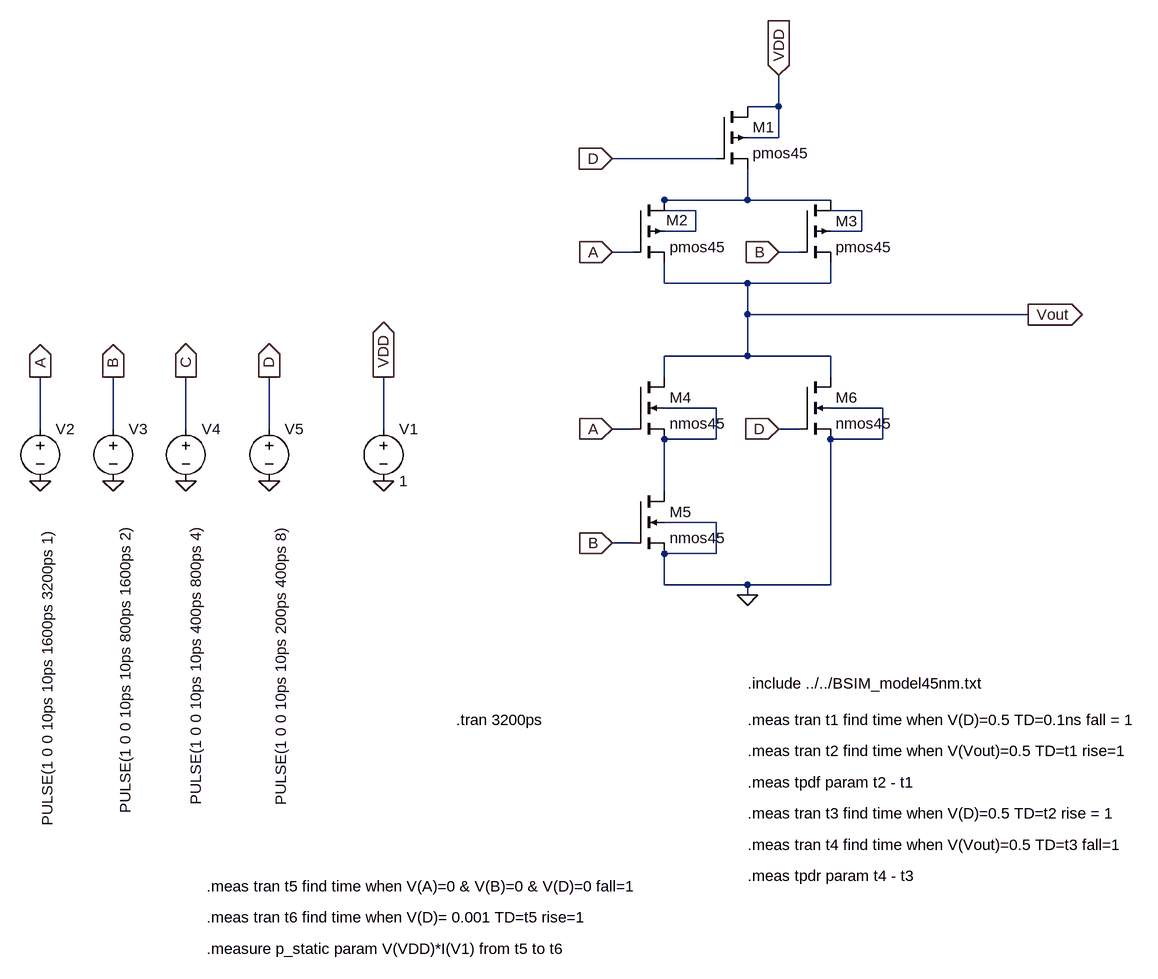
[diagram p0: schematic Eksamen_Kredsloeb.asc]
Eksamen_Kredsloeb.asc, the LTspice schematic file:
Version 4
SHEET 1 880 1536
WIRE -64 224 -64 176
WIRE -64 224 -112 224
WIRE -64 272 -64 224
WIRE -64 272 -112 272
WIRE -160 304 -320 304
WIRE -112 368 -112 320
WIRE -112 368 -240 368
WIRE 16 368 -112 368
WIRE -240 384 -240 368
WIRE -192 384 -240 384
WIRE 64 384 16 384
WIRE -192 416 -192 384
WIRE -192 416 -240 416
WIRE 64 416 64 384
WIRE 64 416 16 416
WIRE -288 448 -320 448
WIRE -32 448 -64 448
WIRE -240 496 -240 464
WIRE -112 496 -240 496
WIRE 16 496 16 464
WIRE 16 496 -112 496
WIRE -112 544 -112 496
WIRE 320 544 -112 544
WIRE -112 608 -112 544
WIRE -112 608 -240 608
WIRE 16 608 -112 608
WIRE -240 640 -240 608
WIRE 16 640 16 608
WIRE -160 688 -240 688
WIRE 96 688 16 688
WIRE -1200 720 -1200 640
WIRE -1088 720 -1088 640
WIRE -976 720 -976 640
WIRE -848 720 -848 640
WIRE -672 720 -672 640
WIRE -288 720 -320 720
WIRE -32 720 -64 720
WIRE -160 736 -160 688
WIRE -160 736 -240 736
WIRE 96 736 96 688
WIRE 96 736 16 736
WIRE -240 816 -240 736
WIRE -160 864 -240 864
WIRE -288 896 -320 896
WIRE -160 912 -160 864
WIRE -160 912 -240 912
WIRE -240 960 -240 912
WIRE -112 960 -240 960
WIRE 16 960 16 736
WIRE 16 960 -112 960
WIRE -112 976 -112 960
FLAG -320 448 A
IOPIN -320 448 In
FLAG -64 448 B
IOPIN -64 448 In
FLAG -320 304 D
IOPIN -320 304 In
FLAG -64 176 VDD
IOPIN -64 176 In
FLAG -320 720 A
IOPIN -320 720 In
FLAG -320 896 B
IOPIN -320 896 In
FLAG -64 720 D
IOPIN -64 720 In
FLAG -112 976 0
FLAG 320 544 Vout
IOPIN 320 544 Out
FLAG -976 800 0
FLAG -1088 800 0
FLAG -1200 800 0
FLAG -672 800 0
FLAG -1200 640 A
IOPIN -1200 640 Out
FLAG -1088 640 B
IOPIN -1088 640 Out
FLAG -976 640 C
IOPIN -976 640 Out
FLAG -672 640 VDD
IOPIN -672 640 Out
FLAG -848 800 0
FLAG -848 640 D
IOPIN -848 640 Out
SYMBOL pmos4 -160 224 R0
SYMATTR InstName M1
SYMATTR Value pmos45
SYMATTR Value2 l=60nm w=600nm
SYMBOL pmos4 -288 368 R0
WINDOW 0 51 31 Left 2
SYMATTR InstName M2
SYMATTR Value pmos45
SYMATTR Value2 l=60nm w=600nm
SYMBOL pmos4 -32 368 R0
SYMATTR InstName M3
SYMATTR Value pmos45
SYMATTR Value2 l=60nm w=600nm
SYMBOL nmos4 -288 640 R0
SYMATTR InstName M4
SYMATTR Value nmos45
SYMATTR Value2 l=60nm w=400nm
SYMBOL nmos4 -288 816 R0
SYMATTR InstName M5
SYMATTR Value nmos45
SYMATTR Value2 l=60nm w=400nm
SYMBOL nmos4 -32 640 R0
SYMATTR InstName M6
SYMATTR Value nmos45
SYMATTR Value2 l=60nm w=200nm
SYMBOL Voltage -672 704 R0
SYMATTR InstName V1
SYMATTR Value 1
SYMBOL Voltage -1200 704 R0
WINDOW 3 11 628 VLeft 2
SYMATTR InstName V2
SYMATTR Value PULSE(1 0 0 10ps 10ps 1600ps 3200ps 1)
SYMBOL Voltage -1088 704 R0
WINDOW 3 19 608 VLeft 2
SYMATTR InstName V3
SYMATTR Value PULSE(1 0 0 10ps 10ps 800ps 1600ps 2)
SYMBOL Voltage -976 704 R0
WINDOW 3 15 595 VLeft 2
SYMATTR InstName V4
SYMATTR Value PULSE(1 0 0 10ps 10ps 400ps 800ps 4)
SYMBOL Voltage -848 704 R0
WINDOW 3 18 596 VLeft 2
SYMATTR InstName V5
SYMATTR Value PULSE(1 0 0 10ps 10ps 200ps 400ps 8)
TEXT -560 1168 Left 2 !.tran 3200ps
TEXT -112 1168 Left 2 !.meas tran t1 find time when V(D)=0.5 TD=0.1ns fall = 1
TEXT -112 1216 Left 2 !.meas tran t2 find time when V(Vout)=0.5 TD=t1 rise=1
TEXT -112 1264 Left 2 !.meas tpdf param t2 - t1
TEXT -112 1112 Left 2 !.include ../../BSIM_model45nm.txt
TEXT -112 1312 Left 2 !.meas tran t3 find time when V(D)=0.5 TD=t2 rise = 1
TEXT -112 1360 Left 2 !.meas tran t4 find time when V(Vout)=0.5 TD=t3 fall=1
TEXT -112 1408 Left 2 !.meas tpdr param t4 - t3
TEXT -944 1424 Left 2 !.meas tran t5 find time when V(A)=0 & V(B)=0 & V(D)=0 fall=1
TEXT -944 1472 Left 2 !.meas tran t6 find time when V(D)= 0.001 TD=t5 rise=1
TEXT -944 1520 Left 2 !.measure p_static param V(VDD)*I(V1) from t5 to t6

The netlist it stands for:
* Eksamen_Kredsloeb.asc
M1 VDD D N001 VDD pmos45 l=60nm w=600nm
M2 N001 A Vout N001 pmos45 l=60nm w=600nm
M3 N001 B Vout N002 pmos45 l=60nm w=600nm
M4 Vout A N003 N003 nmos45 l=60nm w=400nm
M5 N003 B 0 0 nmos45 l=60nm w=400nm
M6 Vout D 0 0 nmos45 l=60nm w=200nm
V1 VDD 0 1
V2 A 0 PULSE(1 0 0 10ps 10ps 1600ps 3200ps 1)
V3 B 0 PULSE(1 0 0 10ps 10ps 800ps 1600ps 2)
V4 C 0 PULSE(1 0 0 10ps 10ps 400ps 800ps 4)
V5 D 0 PULSE(1 0 0 10ps 10ps 200ps 400ps 8)
.model NMOS NMOS
.model PMOS PMOS
.lib standard.mos
.tran 3200ps
.meas tran t1 find time when V(D)=0.5 TD=0.1ns fall = 1
.meas tran t2 find time when V(Vout)=0.5 TD=t1 rise=1
.meas tpdf param t2 - t1
.include ../../BSIM_model45nm.txt
.meas tran t3 find time when V(D)=0.5 TD=t2 rise = 1
.meas tran t4 find time when V(Vout)=0.5 TD=t3 fall=1
.meas tpdr param t4 - t3
.meas tran t5 find time when V(A)=0 & V(B)=0 & V(D)=0 fall=1
.meas tran t6 find time when V(D)= 0.001 TD=t5 rise=1
.measure p_static param V(VDD)*I(V1) from t5 to t6
.backanno
.end